# EasyEDA Pro project ProPrj_omb-2024-nano_2026-02-09.epro, board PCB1
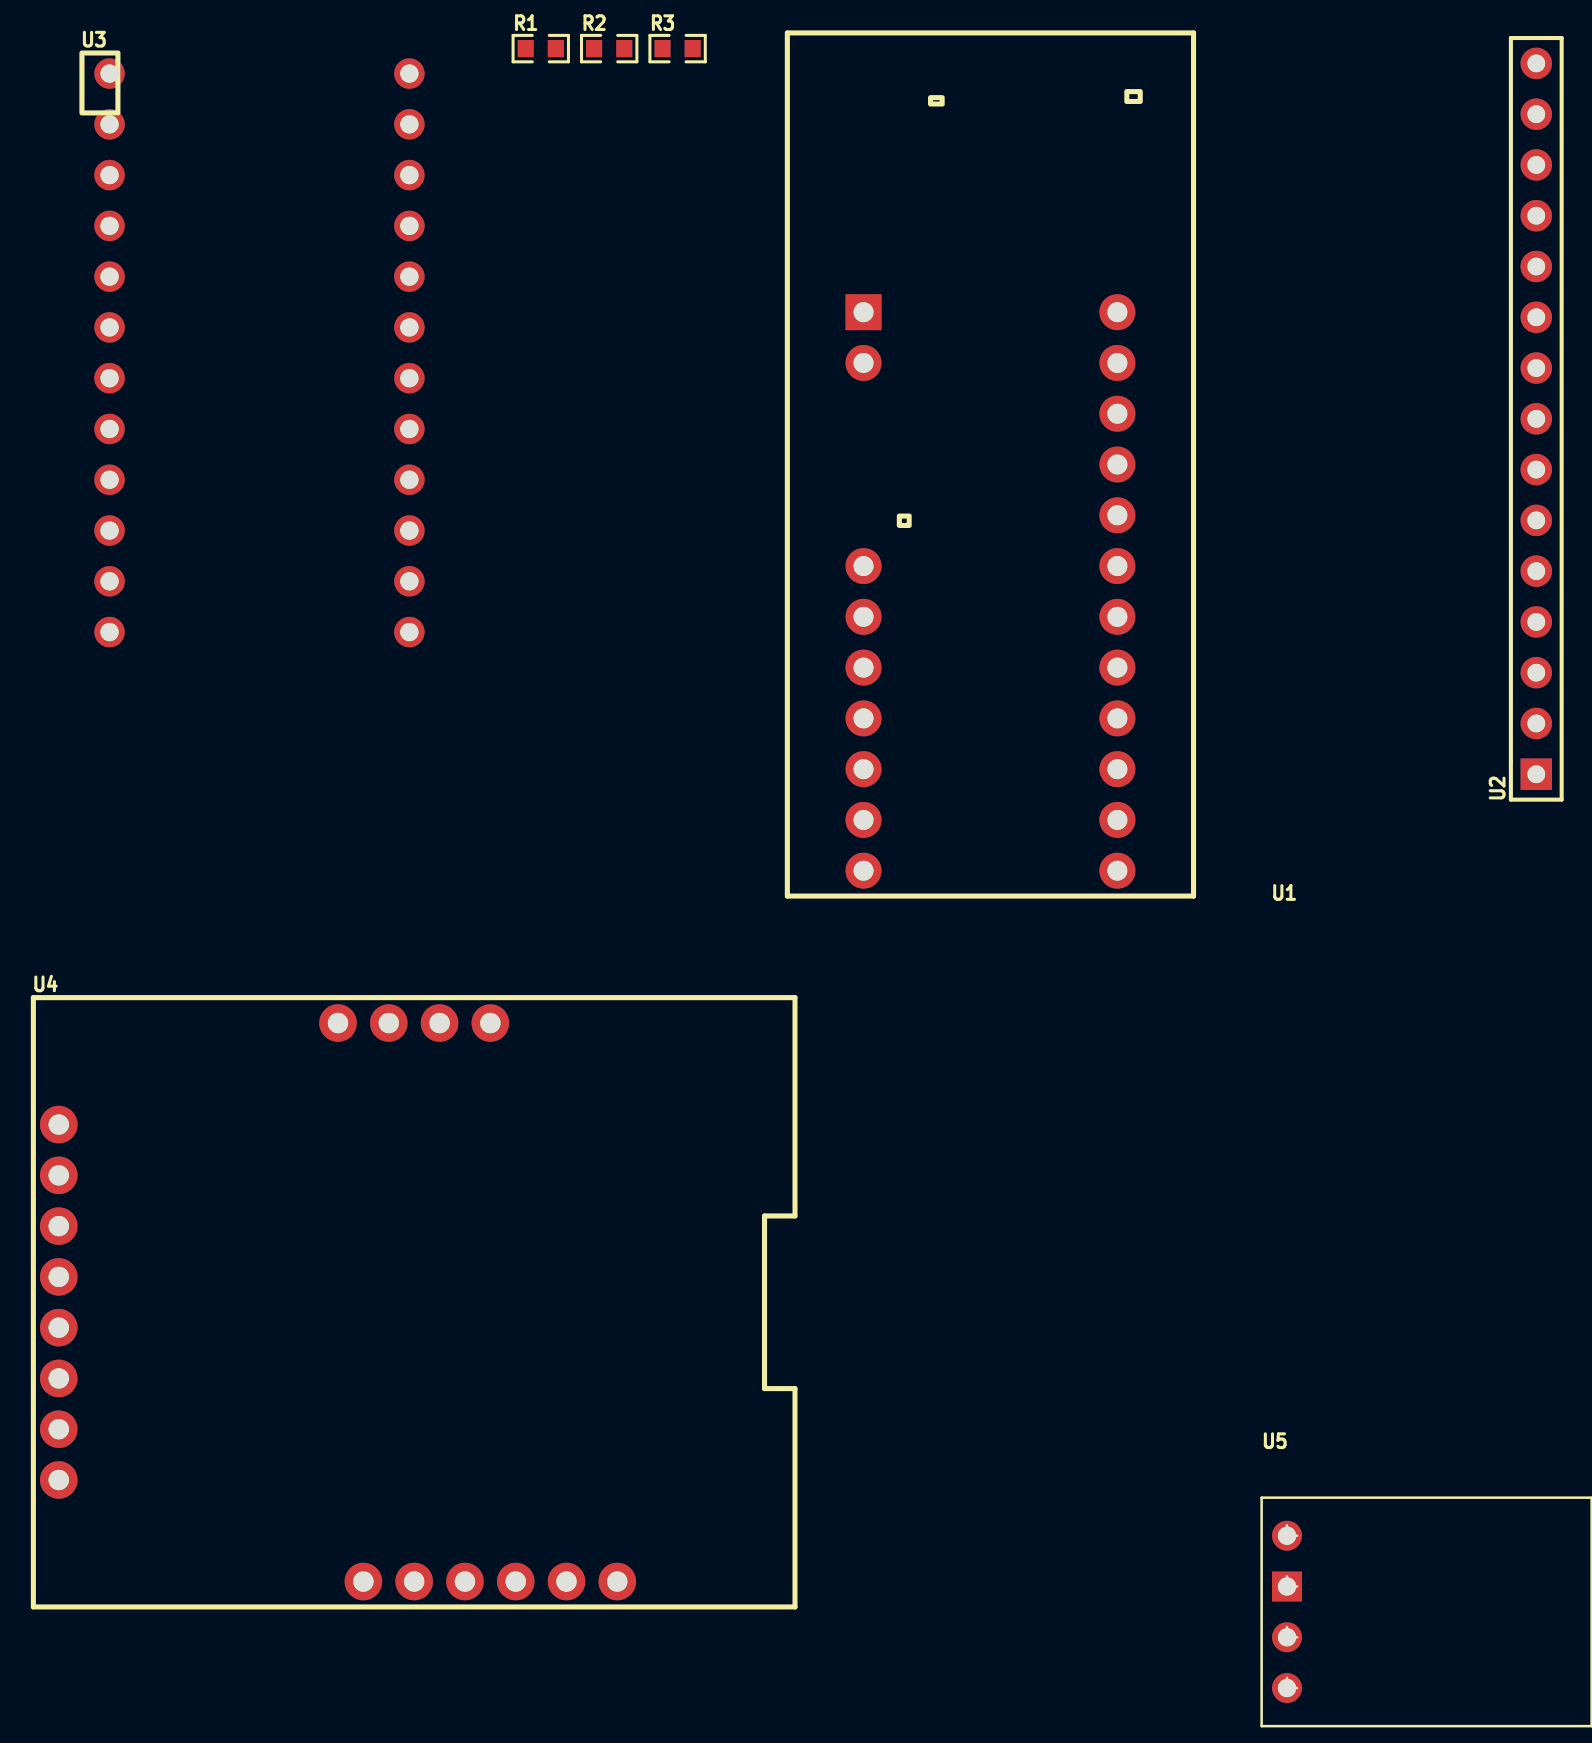
[diagram p11: board, top side]
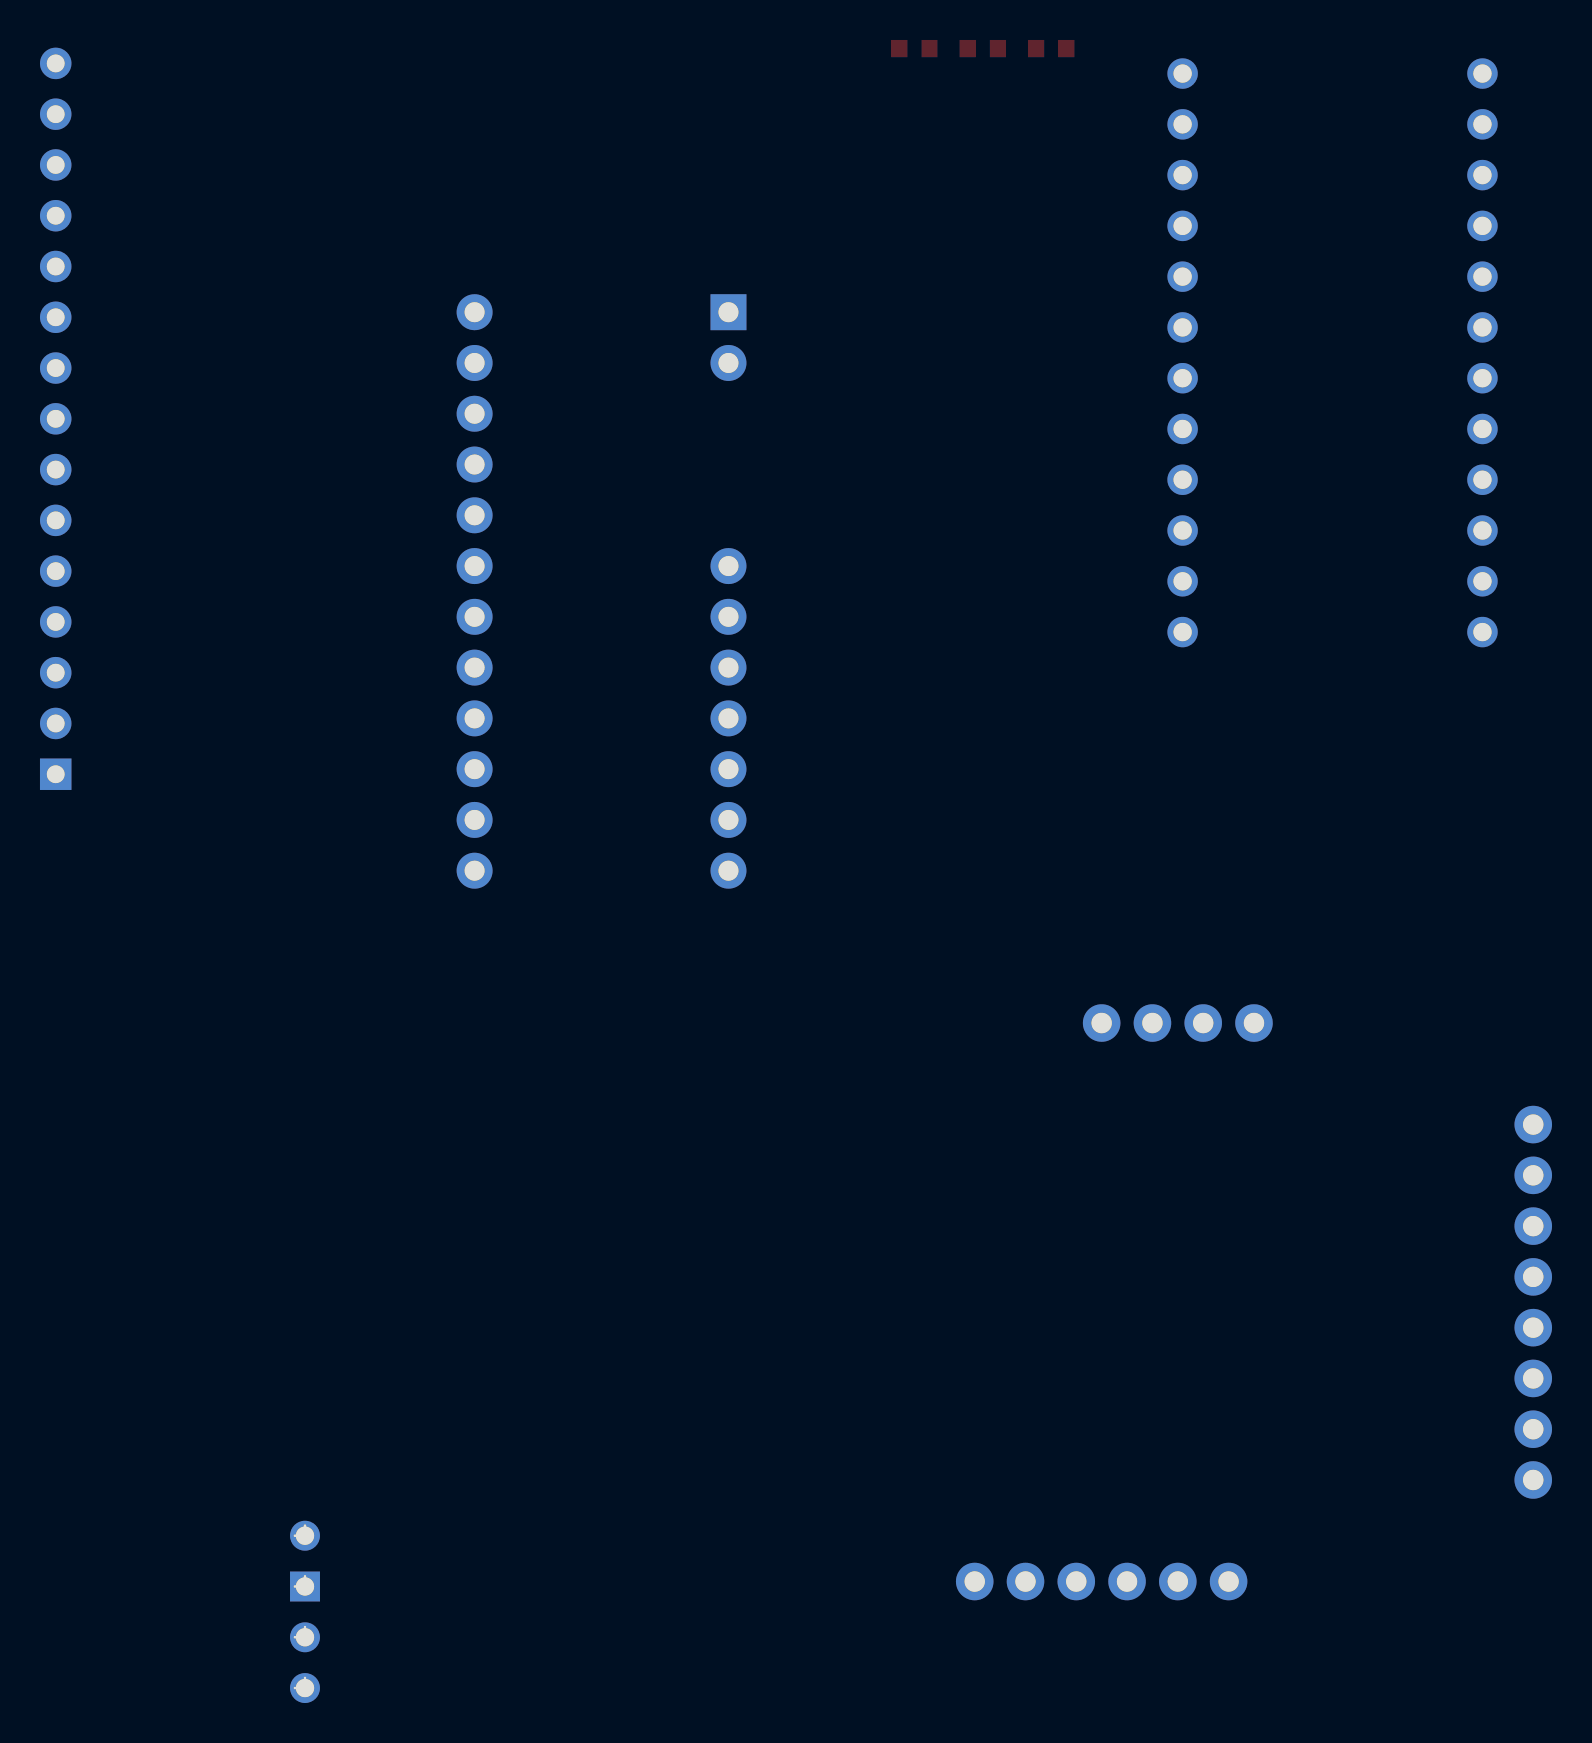
[diagram p12: board, bottom side, seen from below]

Outline 0.51 x 8.13 mm; copper layers: Top Layer, Bottom Layer. Coordinates in mm from the lower left corner of the outline.
Stack: Top Layer 0.035mm / Dielectric1 1.51mm FR4 er 4.5 / Bottom Layer 0.035mm

## Design rules (mm)
template: JLCPCB Capability(Two Layers Board)
spacing copperThickness1oz (default): track to track 0.102, other pairs 0.152 to 0.3
spacing copperThickness2oz: track to track 0.203, other pairs 0.152 to 0.3
track width copperThickness1oz (default): min 0.127, default 0.254, max 2.54
track width copperThickness2oz: min 0.203, default 0.254, max 2.54
differential pair differentialPair (default): width min 0.127, default 0.254, max 2.54; gap min 0.152, default 0.152
via viaSize (default): diameter min 0.5, default 0.61, max 10; hole min 0.3, default 0.305, max 6.3

## Placement (name value [footprint] x y rotation side)
R1  10K  [R0603]  -37.33 82.01 0 top
R2  10K  [R0603]  -33.91 82.01 0 top
R3  10K  [R0603]  -30.49 82.01 0 top
U1  -  [ARTEMIS REDBOARD NANO]  -8.48 40.89 180 top
U2  -  [HDR-F-2.54_1X15]  12.47 63.49 90 top
U3  -  [STEVAL-MKI159V1]  -58.9 80.77 0 top
U4  -  [SPARKFUN_U-BLOX_MAX-M10S]  -62.84 3.93 0 top
U5  -  [S7V8F3]  0 3.81 0 top

## Footprints (pads in the part's own frame, mm; a bottom-side part is the same pattern mirrored in y, then rotated)
ARTEMIS REDBOARD NANO
  rect 1.8x1.8 hole 1: 1(12.7,-27.94)
  round 1.8 hole 1: 2(12.7,-25.4) 3(12.7,-15.24) 4(12.7,-12.7) 5(12.7,-10.16) 6(12.7,-7.62) 7(12.7,-5.08) 8(12.7,-2.54) 9(12.7,0) 10(0,0) 11(0,-2.54) 12(0,-5.08) 13(0,-7.62) 14(0,-10.16) 15(0,-12.7) 16(0,-15.24) 17(0,-17.78) 18(0,-20.32) 19(0,-22.86) 20(0,-25.4) 21(0,-27.94)
HDR-F-2.54_1X15
  rect 1.575x1.575 hole 0.889: 1(-17.78,0)
  round 1.575 hole 0.889: 2(-15.24,0) 3(-12.7,0) 4(-10.16,0) 5(-7.62,0) 6(-5.08,0) 7(-2.54,0) 8(0,0) 9(2.54,0) 10(5.08,0) 11(7.62,0) 12(10.16,0) 13(12.7,0) 14(15.24,0) 15(17.78,0)
R0603
  rect 0.806x0.864 smd: 1(-0.753,0) 2(0.753,0)
S7V8F3
  round 1.498 hole 0.914: 1(0,3.81) 3(0,-1.27) 4(0,-3.81)
  rect 1.498x1.498 hole 0.914: 2(0,1.27)
SPARKFUN_U-BLOX_MAX-M10S
  round 1.879 hole 1.021x1.016: 1(1.397,24.257) 2(1.397,21.717) 3(1.397,19.177) 4(1.397,16.637) 5(1.397,14.097) 6(1.397,11.557) 7(1.397,9.017) 8(1.397,6.477)
  round 1.879 hole 1.016x1.021: 9(16.637,1.397) 10(19.177,1.397) 11(21.717,1.397) 12(24.257,1.397) 13(26.797,1.397) 14(29.337,1.397) 15(15.367,29.337) 16(17.907,29.337) 17(20.447,29.337) 18(22.987,29.337)
STEVAL-MKI159V1
  round 1.524 hole 0.914: 1(0,0) 2(0,-2.54) 3(0,-5.08) 4(0,-7.62) 5(0,-10.16) 6(0,-12.7) 7(0,-15.24) 8(0,-17.78) 9(0,-20.32) 10(0,-22.86) 11(0,-25.4) 12(0,-27.94) 13(15,-27.94) 14(15,-25.4) 15(15,-22.86) 16(15,-20.32) 17(15,-17.78) 18(15,-15.24) 19(15,-12.7) 20(15,-10.16) 21(15,-7.62) 22(15,-5.08) 23(15,-2.54) 24(15,0)

## Nets
As in the schematic.

Pads without a net: U1 1 2 3 4 5 6 13 17 19 21; U2 1 4 5 8 9 10 15; U3 3 6 7 8 9 10 11 12 14 15 16 17 18 23 24; U4 3 4 5 6 8 9 10 11 13; U5 4
